# Altium project Secondary-PCB-v1.1.PrjPcb
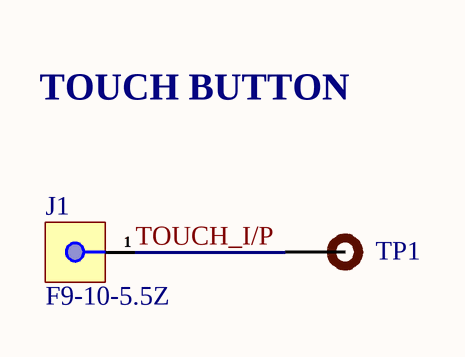
[diagram p0: Touch-Button-Sheet.SchDoc]
1 sheet, 2 parts. Net scope: strictly hierarchical (ports join the sheet entries above them; power ports are local).
Board file: Secondary-PCB-v1.1.PcbDoc

## Sheet Touch-Button-Sheet.SchDoc
size A4; SheetNumber: 1; SheetTotal: 1

### Parts
J1  F9-10-5.5Z  [F9-10-5.5Z]
TP1  0.5mm Test Pad  [0.5mm Test Pad]  (value not drawn)  (no BOM)

### Nets
TOUCH_I/P: J1.1 TP1.1

### Notes on the sheet
- TOUCH BUTTON
- File:
- Title:
- Date:
- Page
- Num:
- Total:
- Drawn By: Huzaifa Ali

### Library data of the parts
J1 = F9-10-5.5Z: Press spring; Manufacturer: Sam&wing; Manufacturer Part Number: F9-10-5.5Z; Package: Custom; LCSC Part Number: C5143797; Item Type: Press spring; ComponentLink1Description: LCSC; ComponentLink1URL: https://www.lcsc.com/product-detail/Press-spring_Sam-wing-F9-10-5-5Z_C5143797.html
TP1 = 0.5mm Test Pad: Test pad